# Altium project esp32p10displayProject.PrjPcb
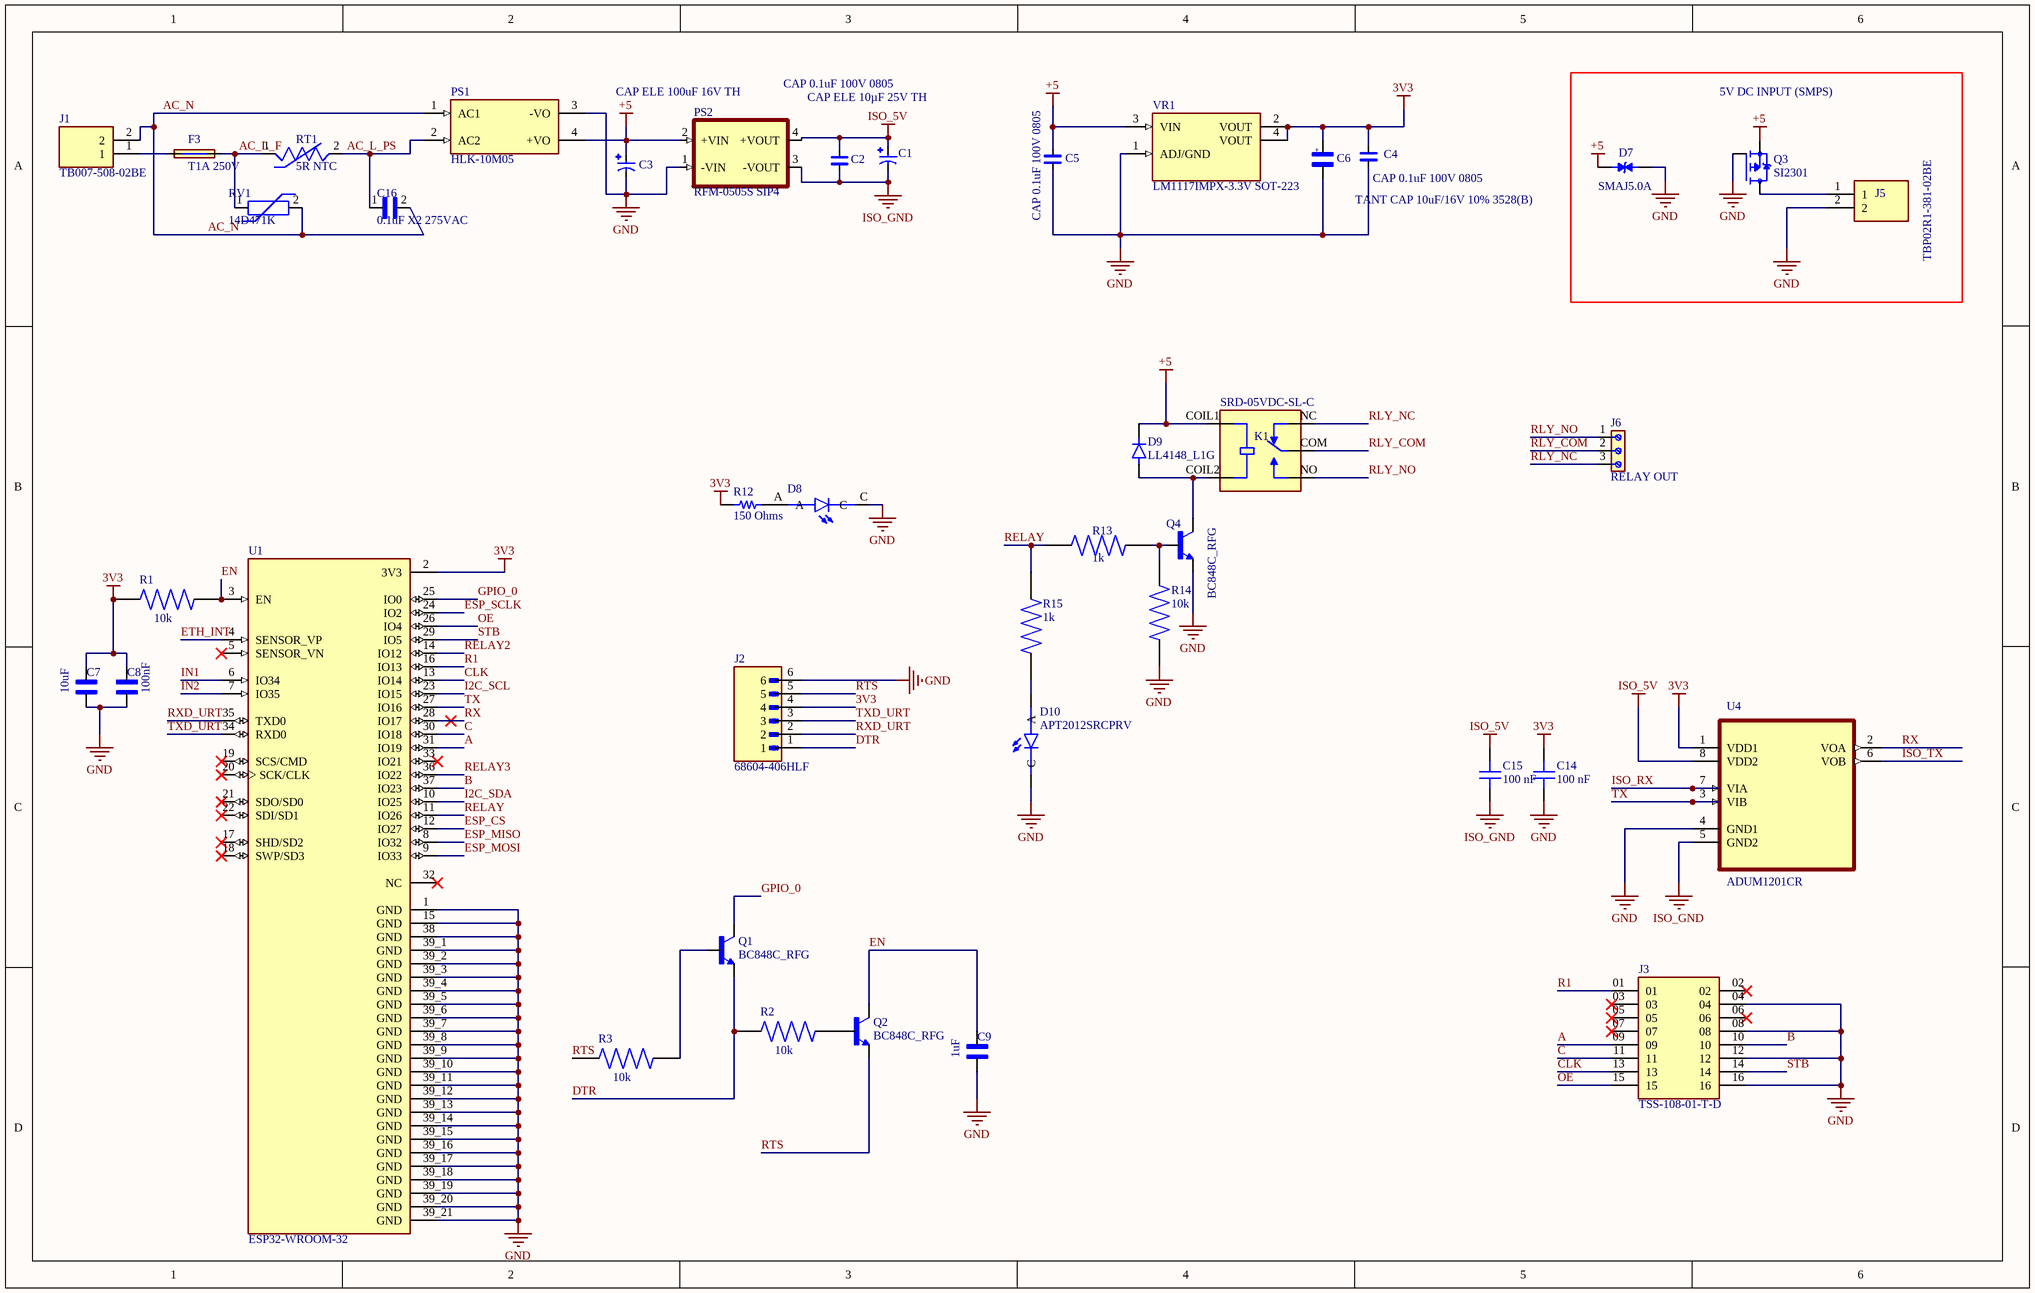
[diagram p0: esp32p10displaySheet1.SchDoc]
4 sheets, 134 parts. Net scope: global (net labels, ports and power ports of the same name join across sheets).
Board file: esp32p10displayPCB1.PcbDoc
Sheets:
  esp32p10displaySheet1.SchDoc
  esp32p10displaySheet2.SchDoc
  esp32p10displaySheet3.SchDoc
  esp32p10displaySheet4.SchDoc

## Sheet esp32p10displaySheet1.SchDoc
size 381 x 241 mm; SheetNumber: 1; SheetTotal: 4

### Parts
C1  CAP ELE 10µF 25V TH  [CAP ELE 10µF 25V TH]
C2  CAP 0.1uF 100V 0805  [CAP CER 0.1uF/50V 5%]
C3  CAP ELE 100uF 16V TH  [CAP ELE 10µF 25V TH]
C4  CAP 0.1uF 100V 0805  [CAP CER 0.1uF/50V 5%]
C5  CAP 0.1uF 100V 0805  [CAP CER 0.1uF/50V 5%]
C6  TANT CAP 10uF/16V 10% 3528(B)  [TANT CAP 3528(B)]
C7  10uF  [CAPC3216X175N]
C8  100nF  [CAPC3216X175N]
C9  1uF  [CAPC3216X175N]
C14  Capacitance: 100 nF  [CAP 0805_2012]  (hidden comment: 100nF)
C15  Capacitance: 100 nF  [CAP 0805_2012]  (hidden comment: 100nF)
C16  0.1uF X2 275VAC  [CAPRR1500W60L1750T500H1200]
D7  SMAJ5.0A  [DIOM4325X250N]
D8  597-3305-607F  [LEDC2012X70N]  (value not drawn)
D9  LL4148_L1G  [DIOMELF3515N]
D10  APT2012SRCPRV  [LEDC2012X75N]
F3  T1A 250V  [TR5]
J1  TB007-508-02BE  [CUI_TB007-508-02BE]
J2  68604-406HLF  [AMPHENOL_68604-406HLF]
J3  TSS-108-01-T-D  [SAMTEC_TSS-108-01-T-D]
J5  TBP02R1-381-02BE  [CUI_TBP02R138102BE]
J6  RELAY OUT  [691236510003]
K1  SRD-05VDC-SL-C  [RELAY_SRD-03VDC-SL-C]
PS1  HLK-10M05  [CONV_HLK-10M05]
PS2  RFM-0505S SIP4  [RFM-0505S]
Q1  BC848C_RFG  [SOT95P237X112-3N]
Q2  BC848C_RFG  [SOT95P237X112-3N]
Q3  SI2301  [DESTO_SOT23]
Q4  BC848C_RFG  [SOT95P237X112-3N]
R1  10k  [RES_ERA6VRB1002V]
R2  10k  [RES_ERA6VRB1002V]
R3  10k  [RES_ERA6VRB1002V]
R12  150 Ohms  [RES 0805_2012]
R13  1k  [RES_ERA6VRB1002V]
R14  10k  [RES_ERA6VRB1002V]
R15  1k  [RES_ERA6VRB1002V]
RT1  5R NTC  [THRMRB500W60L1150T500H1600]
RV1  14D471K  [MOV14D471K]
U1  ESP32-WROOM-32  [MODULE_ESP32-WROOM-32]
U4  ADUM1201CR  [SOIC127P600X175-8N]
VR1  LM1117IMPX-3.3V SOT-223  [LM1117IMPX-3.3V SOT-223]

### Blocks framed on the sheet
5V DC INPUT (SMPS): D7 J5 Q3

### Nets
3V3: C4.2 C6.1 C7.1 C8.1 C14.2 J2.4 R1.1 R12.1 U1.2(3V3) U4.1(VDD1) VR1.2(VOUT) VR1.4(VOUT)
+5: C3.P C5.2 D7.C D9.C(K) K1.COIL1 PS1.4(+VO) PS2.2(+VIN) Q3.2(S) VR1.3(VIN)
GND: C3.N C4.1 C5.1 C6.2 C7.2 C8.2 C9.2 C14.1 D7.A D8.C D10.C J2.6 J3.04 J3.08 J3.12 J3.16 J5.2 PS1.3(-VO) PS2.1(-VIN) Q3.1(G) Q4.2(E) R14.1 U1.1(GND) U1.15(GND) U1.38(GND) U1.39_1(GND) U1.39_2(GND) U1.39_3(GND) U1.39_4(GND) U1.39_5(GND) U1.39_6(GND) U1.39_7(GND) U1.39_8(GND) U1.39_9(GND) U1.39_10(GND) U1.39_11(GND) U1.39_12(GND) U1.39_13(GND) U1.39_14(GND) U1.39_15(GND) U1.39_16(GND) U1.39_17(GND) U1.39_18(GND) U1.39_19(GND) U1.39_20(GND) U1.39_21(GND) U4.4(GND1) VR1.1(ADJ/GND)
ISO_5V: C1.P C2.2 C15.2 PS2.4(+VOUT) U4.8(VDD2)
ISO_GND: C1.N C2.1 C15.1 PS2.3(-VOUT) U4.5(GND2)
A: J3.09 U1.31(IO19)
AC_L_F: F3.2 RT1.1 RV1.1
AC_L_PS: C16.1 PS1.2(AC2) RT1.2
AC_N: C16.2 J1.2 PS1.1(AC1) RV1.2
B: J3.10 U1.37(IO23)
C: J3.11 U1.30(IO18)
CLK: J3.13 U1.13(IO14)
DTR: J2.1 Q1.2(E) R2.1
EN: C9.1 Q2.3(C) R1.2 U1.3(EN)
ESP_CS: U1.12(IO27)
ESP_MISO: U1.8(IO32)
ESP_MOSI: U1.9(IO33)
ESP_SCLK: U1.24(IO2)
ETH_INT: U1.4(SENSOR_VP)
GPIO_0: Q1.3(C) U1.25(IO0)
I2C_SCL: U1.23(IO15)
I2C_SDA: U1.10(IO25)
IN1: U1.6(IO34)
IN2: U1.7(IO35)
ISO_RX: U4.7(VIA)
ISO_TX: U4.6(VOB)
OE: J3.15 U1.26(IO4)
R1: J3.01 U1.16(IO13)
RELAY: R13.1 R15.2 U1.11(IO26)
RELAY2: U1.14(IO12)
RELAY3: U1.36(IO22)
RLY_COM: J6.2 K1.COM
RLY_NC: J6.3 K1.NC
RLY_NO: J6.1 K1.NO
RTS: J2.5 Q2.2(E) R3.1
RX: U1.28(IO17) U4.2(VOA)
RXD_URT: J2.2 U1.35(TXD0)
STB: J3.14 U1.29(IO5)
TX: U1.27(IO16) U4.3(VIB)
TXD_URT: J2.3 U1.34(RXD0)
NetD8_A: D8.A R12.2
NetD9_A: D9.A K1.COIL2 Q4.3(C)
NetD10_A: D10.A R15.1
NetF3_1: F3.1 J1.1
NetJ5_1: J5.1 Q3.3(D)
NetQ1_1: Q1.1(B) R3.2
NetQ2_1: Q2.1(B) R2.2
NetQ4_1: Q4.1(B) R13.2 R14.2

Not connected (* = marked no-connect by the designer): J3 02* 03* 05* 06* 07*; U1 5(SENSOR_VN)* 17(SHD/SD2)* 18(SWP/SD3)* 19(SCS/CMD)* 20(SCK/CLK)* 21(SDO/SD0)* 22(SDI/SD1)* 32(NC)* 33(IO21)*

### Notes on the sheet
- (in symbol TANT CAP 10uF/16V 5% 3528(B)) +

### Library data of the parts
C1 = CAP ELE 10µF 25V TH: 10µF 25V Aluminum Electrolytic Capacitors Radial Lead Type TH, Dia-5mm, Pitch-2mm ECEA1EN100UI; MF: Panasonic; Package: RADIAL-2 Panasonic; Purchase-URL: https://pricing.snapeda.com/search/part/ECEA1EN100UI/?ref=eda; Value: *; Digi-Key_Part_Number: ECE-A1EN100UI-ND; SnapEDA_Link: https://www.snapeda.com/parts/ECEA1EN100UI/Panasonic/view-part/5788532/?ref=snap; MP: ECEA1EN100UI; Check_prices: https://www.snapeda.com/parts/ECEA1EN100UI/Panasonic/view-part/5788532/?ref=eda
C2 = CAP CER 0.1uF/50V 5%: CAP CER 0.1uF/100V  Ceramic Capacitor X7R 0805 (2012 Metric); MF: Samsung; MP: CL21B104KCFNNNE; Purchase-URL: https://pricing.snapeda.com/search?q=CL21B104KCFNNNE&ref=eda; Package: 0805 Samsung; Check_prices: https://www.snapeda.com/parts/CL21B104KCFNNNE/Samsung+Electro-Mechanics/view-part/?ref=eda; Value: *; SnapEDA_Link: https://www.snapeda.com/parts/CL21B104KCFNNNE/Samsung+Electro-Mechanics/view-part/?ref=snap; Digi-Key_Part_Number: 1276-6840-2-ND
C3 = CAP ELE 10µF 25V TH: 100uF 16V Aluminum Electrolytic Capacitor Radial TH, Dia-5mm x 11mm (Panasonic M series); MP: ECA-1CM101; Package: RADIAL-2 Panasonic; MF: Panasonic; Value: *
C4 C5 = CAP CER 0.1uF/50V 5%: CAP CER 0.1uF/100V  Ceramic Capacitor X7R 0805 (2012 Metric) SMT; MF: Samsung; MP: CL21B104KCFNNNE; Purchase-URL: https://pricing.snapeda.com/search?q=CL21B104KCFNNNE&ref=eda; Package: 0805 Samsung; Check_prices: https://www.snapeda.com/parts/CL21B104KCFNNNE/Samsung+Electro-Mechanics/view-part/?ref=eda; Value: *; SnapEDA_Link: https://www.snapeda.com/parts/CL21B104KCFNNNE/Samsung+Electro-Mechanics/view-part/?ref=snap; Digi-Key_Part_Number: 1276-6840-2-ND
C6 = TANT CAP 10uF/16V 5% 3528(B): 10 µF Molded Tantalum Capacitor 16V 10% 1411 (3528 Metric), 1210 TAJB106K016RNJ; MF: AVX; SnapEDA_Link: https://www.snapeda.com/parts/TAJB106K016RNJ/AVX/view-part/?ref=snap; Package: 1210 AVX; Value: *; MP: TAJB106K016RNJ; Check_prices: https://www.snapeda.com/parts/TAJB106K016RNJ/AVX/view-part/?ref=eda
C7 = C1206C102KGRACAUTO: 10 µF ±10% 16V Ceramic Capacitor X7R 1206 (3216 Metric); MF: Murata; MP: GRM31CR71C106KAC7L; SnapEDA_Link: https://www.snapeda.com/search?q=GRM31CR71C106KAC7L&ref=snap; Package: 3216 KEMET; Value: *; Check_prices: https://www.snapeda.com/search?q=GRM31CR71C106KAC7L&ref=eda
C8 = C1206C102KGRACAUTO: 0.1 µF ±10% 50V Ceramic Capacitor X7R 1206 (3216 Metric); MF: KEMET; MP: C1206C104K5RACTU; SnapEDA_Link: https://www.snapeda.com/search?q=C1206C104K5RACTU&ref=snap; Package: 3216 KEMET; Value: *; Check_prices: https://www.snapeda.com/search?q=C1206C104K5RACTU&ref=eda
C9 = C1206C102KGRACAUTO: 1 µF ±10% 50V Ceramic Capacitor X7R 1206 (3216 Metric); MF: KEMET; MP: C1206C105K5RACTU; SnapEDA_Link: https://www.snapeda.com/search?q=C1206C105K5RACTU&ref=snap; Package: 3216 KEMET; Value: *; Check_prices: https://www.snapeda.com/search?q=C1206C105K5RACTU&ref=eda
C14 C15 = C0805C102F3HACAUTO: CAP CER 0805 0.1UF 100V X7R; Part Number: CL21B104KCFNNNE; manufacturer: Samsung Electro-Mechanics; Tolerance: ±10%; Applications: General Purpose; componentlink1description: Datasheet; componentlink1url: https://pricing.snapeda.com/search?q=CL21B104KCFNNNE&ref=eda; componentlink2description: DigiKey Link; componentlink2url: https://www.digikey.com/en/products/result?keywords=CL21B104KCFNNNE; Device Package: 0805 (2012 Metric); lastupdated: 09-02-2024 8.15.10 PM; Lifecycle Status: Active; Minimum Order: 1; Mounting Type: Surface Mount, MLCC; Operating Temperature: -55°C ~ 125°C; Package / Case: 0805 (2012 Metric); packaging: TapeAndReel; Part Status: Active; series: CL; Size / Dimension: 0.079" L x 0.049" W (2.00mm x 1.25mm); Supplier 1: DigiKey; Temperature Coefficient: X7R; Thickness (Max): 0.85mm; value: 100 nF; Voltage - Rated: 100V
C16 = ECQUAAF104M: Film Capacitor X2 0.1uF 275VAC 15mm pitch; Availability: Unavailable; Price: None; MP: ECQUAAF104M; Package: None; Value: *
D7 = SMAJ7.5CA: TVS diode unidirectional 5V standoff 400W SMA (DO-214AC); pin 1 = cathode; Availability: Unavailable; Package: None; MP: SMAJ5.0A; Value: *; Price: None
D8 = 597-3305-607F: LED Uni-Color Green 4-Pin Chip 0805 T/R; Availability: Unavailable; Value: *; Price: None; MP: 597-3305-607F; Package: None
D10 = APT2012SRCPRV: Red 640nm LED Indication - Discrete 1.85V 0805 (2012 Metric); MF: Kingbright; SnapEDA_Link: https://www.snapeda.com/parts/APT2012SRCPRV/Kingbright/view-part/?ref=snap; Package: 0805 Kingbright; Value: *; MP: APT2012SRCPRV; Check_prices: https://www.snapeda.com/parts/APT2012SRCPRV/Kingbright/view-part/?ref=eda
F3 = TR5: Fuse TR5 1A Time-Lag 250VAC (Littelfuse 372 series); MF: Taiyo Yuden; SnapEDA_Link: https://www.snapeda.com/parts/TR5/Taiyo+Yuden/view-part/?ref=snap; Package: None; Value: *; MP: TR5; Check_prices: https://www.snapeda.com/parts/TR5/Taiyo+Yuden/view-part/?ref=eda
J1 = TB007-508-02BE: 2~24 Poles, Screw Type, Horizontal, 5.08 Pitch, 24~12 (AWG), Terminal Block Connector; MF: Same Sky; SnapEDA_Link: https://www.snapeda.com/parts/TB007-508-02BE/Same+Sky/view-part/?ref=snap; Package: None; Value: *; MP: TB007-508-02BE; Check_prices: https://www.snapeda.com/parts/TB007-508-02BE/Same+Sky/view-part/?ref=eda
J2 = 68604-406HLF: BergStik, Board to Board connector, Unshrouded Vertical Header, Through Hole, Single Row, 6 Positions, 2.54 mm (0.100in) Pitch.; MF: AMPHENOL ICC / FCI; SnapEDA_Link: https://www.snapeda.com/parts/68604-406HLF/Amphenol/view-part/?ref=snap; Package: None; Value: *; MP: 68604-406HLF; Check_prices: https://www.snapeda.com/parts/68604-406HLF/Amphenol/view-part/?ref=eda
J5 = TBP02R138102BE: Terminal block header 2-pos 3.81 mm, right angle (mating plug TBP01P1-381-02BE); MF: Same Sky (CUI); SnapEDA_Link: https://www.snapeda.com/parts/TBP02R1-381-02BE/Same+Sky/view-part/?ref=snap; Package: None; Value: *; MP: TBP02R1-381-02BE; Check_prices: https://www.snapeda.com/parts/TBP02R1-381-02BE/Same+Sky/view-part/?ref=eda
J6 = 691236510003: 3 Position Wire to Board Terminal Block Horizontal with Board 0.200 (5.08mm) Through Hole; MF: WÃ¼rth Elektronik; SnapEDA_Link: https://www.snapeda.com/parts/691236510003/W%25C3%25BCrth+Elektronik+Midcom/view-part/?ref=snap; Package: None; Value: *; MP: 691236510003; Check_prices: https://www.snapeda.com/parts/691236510003/W%25C3%25BCrth+Elektronik+Midcom/view-part/?ref=eda
K1 = SRD-03VDC-SL-C: Relays General Purpose Non Latching 3VDC SPDT 10A (250VAC) Max 5PIN; Manufacturer: Songle; MF: Songle Relay; SnapEDA_Link: https://www.snapeda.com/parts/SRD-03VDC-SL-C/Songle+Relay/view-part/?ref=snap; Package: NON STANDARD-5 Songle Relay; Value: *; MP: SRD-05VDC-SL-C; Check_prices: https://www.snapeda.com/parts/SRD-03VDC-SL-C/Songle+Relay/view-part/?ref=eda
PS1 = HLK-10M05: 10W Ultra-Compact Power Module; MF: Hi-link; SnapEDA_Link: https://www.snapeda.com/parts/HLK-10M05/Hi-link/view-part/?ref=snap; Package: Package; Value: *; MP: HLK-10M05; Check_prices: https://www.snapeda.com/parts/HLK-10M05/Hi-link/view-part/?ref=eda
PS2 = RFM-0505S: DC-DC Converter/Isolator, SIP4, 1kV unreg, Single Output, 1W, 5V Out, RFM Series | RECOM Power Inc. RFM-0505S; SnapEDA_Link: https://www.snapeda.com/parts/RFM-0505S/Recom+Power/view-part/?ref=snap; Package: SIP-4 Recom Power; Value: *; MF: Recom Power; MP: RFM-0505S; Check_prices: https://www.snapeda.com/parts/RFM-0505S/Recom+Power/view-part/?ref=eda
Q1 Q2 Q4 = BC848C_RFG: SOT-23, 30V, 0.1A, NPN Transistor; MF: Taiwan Semiconductor; MP: BC848C RFG; SnapEDA_Link: https://www.snapeda.com/parts/BC848C%20RFG/Taiwan+Semiconductor/view-part/?ref=snap; Package: SOT-23 Taiwan Semiconductor; Value: *; Check_prices: https://www.snapeda.com/parts/BC848C%20RFG/Taiwan+Semiconductor/view-part/?ref=eda
Q3 = SI2301: P-MOSFET 20V 2.3A SOT-23, reverse-polarity protection for 5V DC input; MF: Vishay; MP: SI2301CDS-T1-GE3; SnapEDA_Link: https://www.snapeda.com/parts/SI2301/Micro+Commercial+Components/view-part/?ref=snap; Package: SOT-23 MCC; Value: *; Check_prices: https://www.snapeda.com/parts/SI2301/Micro+Commercial+Components/view-part/?ref=eda
R1-R3 R14 = ERA6VRB1002V: Availability: Unavailable; Package: None; MP: ERA6VRB1002V; Value: *; Price: None
R12 = CRCW0805330RFKEAHP: RES SMD 150 OHM 1% 1/2W 0805; Part Number: CRCW0805150RFKEAHP; Manufacturer: Vishay Dale; Power (Watts): 0.5W, 1/2W; Temperature Coefficient: ±100ppm/°C; Value: 150 Ohms; ComponentLink1Description: Datasheet; ComponentLink1URL: http://www.vishay.com/docs/20043/crcwhpe3.pdf; ComponentLink2Description: DigiKey Link; ComponentLink2URL: https://www.digikey.com/en/products/detail/vishay-dale/CRCW0805150RFKEAHP/2222332; Composition: Thick Film; Device Package: 0805 (2012 Metric); Features: Automotive AEC-Q200, Pulse Withstanding; Height - Seated (Max): 0.020" (0.50mm); LastUpdated: 08-02-2024 9.02.28 PM; Lifecycle Status: Active; Minimum Order: 1; Number of Terminations: 2; Operating Temperature: -55°C ~ 155°C; Package / Case: 0805 (2012 Metric); Packaging: TapeAndReel; PartId: 30364; Part Status: Active; Price: 0.02; Ratings: AEC-Q200; Resistance: 150 Ohms; Series: CRCW-HP; Size / Dimension: 0.079" L x 0.049" W (2.00mm x 1.25mm); Supplier 1: DigiKey; Supplier Part Number 1: 541-150TCT-ND; Supplier Device Package: 0805; Tolerance: ±1%
R13 R15 = ERA6VRB1002V: MP: ERA6VRB1001V; Availability: Unavailable; Package: None; Value: *; Price: None
RT1 = B57236S0509M000: NTC Inrush Current Limiter 5 Ohm 20% 4.5A 11.5mm; MF: EPCOS - TDK Electronics; SnapEDA_Link: https://www.snapeda.com/parts/B57236S0509M000/TDK/view-part/?ref=snap; Package: None; Value: *; MP: B57236S0509M000; Check_prices: https://www.snapeda.com/parts/B57236S0509M000/TDK/view-part/?ref=eda
RV1 = MOV-14D471K: Varistor 14mm 470V (300VAC); MF: HuaXingAn Electronics; SnapEDA_Link: https://www.snapeda.com/parts/MOV-14D471K/HuaXingAn+Electronics/view-part/?ref=snap; Package: None; Value: *; MP: MOV-14D471K; Check_prices: https://www.snapeda.com/parts/MOV-14D471K/HuaXingAn+Electronics/view-part/?ref=eda
U1 = ESP32-WROOM-32: Bluetooth, WiFi 802.11b/g/n, Bluetooth v4.2 +EDR, Class 1, 2 and 3 Transceiver Module 2.4GHz ~ 2.5GHz Antenna Not Included, U.FL Surface Mount; MF: Espressif Systems; Price: None; Availability: In Stock; MP: ESP32-WROOM-32; Package: Module Espressif Systems; SnapEDA_Link: https://www.snapeda.com/parts/ESP32-WROOM-32/Espressif+Systems/view-part/?ref=snap; Check_prices: https://www.snapeda.com/parts/ESP32-WROOM-32/Espressif+Systems/view-part/?ref=eda; Value: *; Purchase-URL: https://pricing.snapeda.com/search/part/ESP32-WROOM-32/?ref=eda
U4 = ADUM1201CR: General Purpose Digital Isolator 2500Vrms 2 Channel 25Mbps 8-SOIC; MF: Analog Devices; SnapEDA_Link: https://www.snapeda.com/parts/ADUM1201CR/Analog+Devices/view-part/?ref=snap; Package: SOIC-8 Analog Devices; Value: *; MP: ADUM1201CR; Check_prices: https://www.snapeda.com/parts/ADUM1201CR/Analog+Devices/view-part/?ref=eda
VR1 = LM1117IMPX-3.3V SOT-223: LM1117IMPX-3.3V 800-mA 15-V linear voltage regulator SOT-223; MF: Texas Instruments; MP: LM1117IMPX-3.3/NOPB; SnapEDA_Link: https://www.snapeda.com/parts/LM1117IMPX-3.3/NOPB/Texas+Instruments/view-part/?ref=snap; Package: SOT-223-4 Texas Instruments; Value: *; Check_prices: https://www.snapeda.com/parts/LM1117IMPX-3.3/NOPB/Texas+Instruments/view-part/?ref=eda
D9 = LL4148_L1G: MP: LL4148_L1G; Price: None; Package: None; Availability: Unavailable; Value: *
J3 = TSS-108-01-T-D: Availability: Unavailable; MP: TSS-108-01-T-D; Value: *; Price: None; Package: None

## Sheet esp32p10displaySheet2.SchDoc
size A4; SheetNumber: 2; SheetTotal: 4
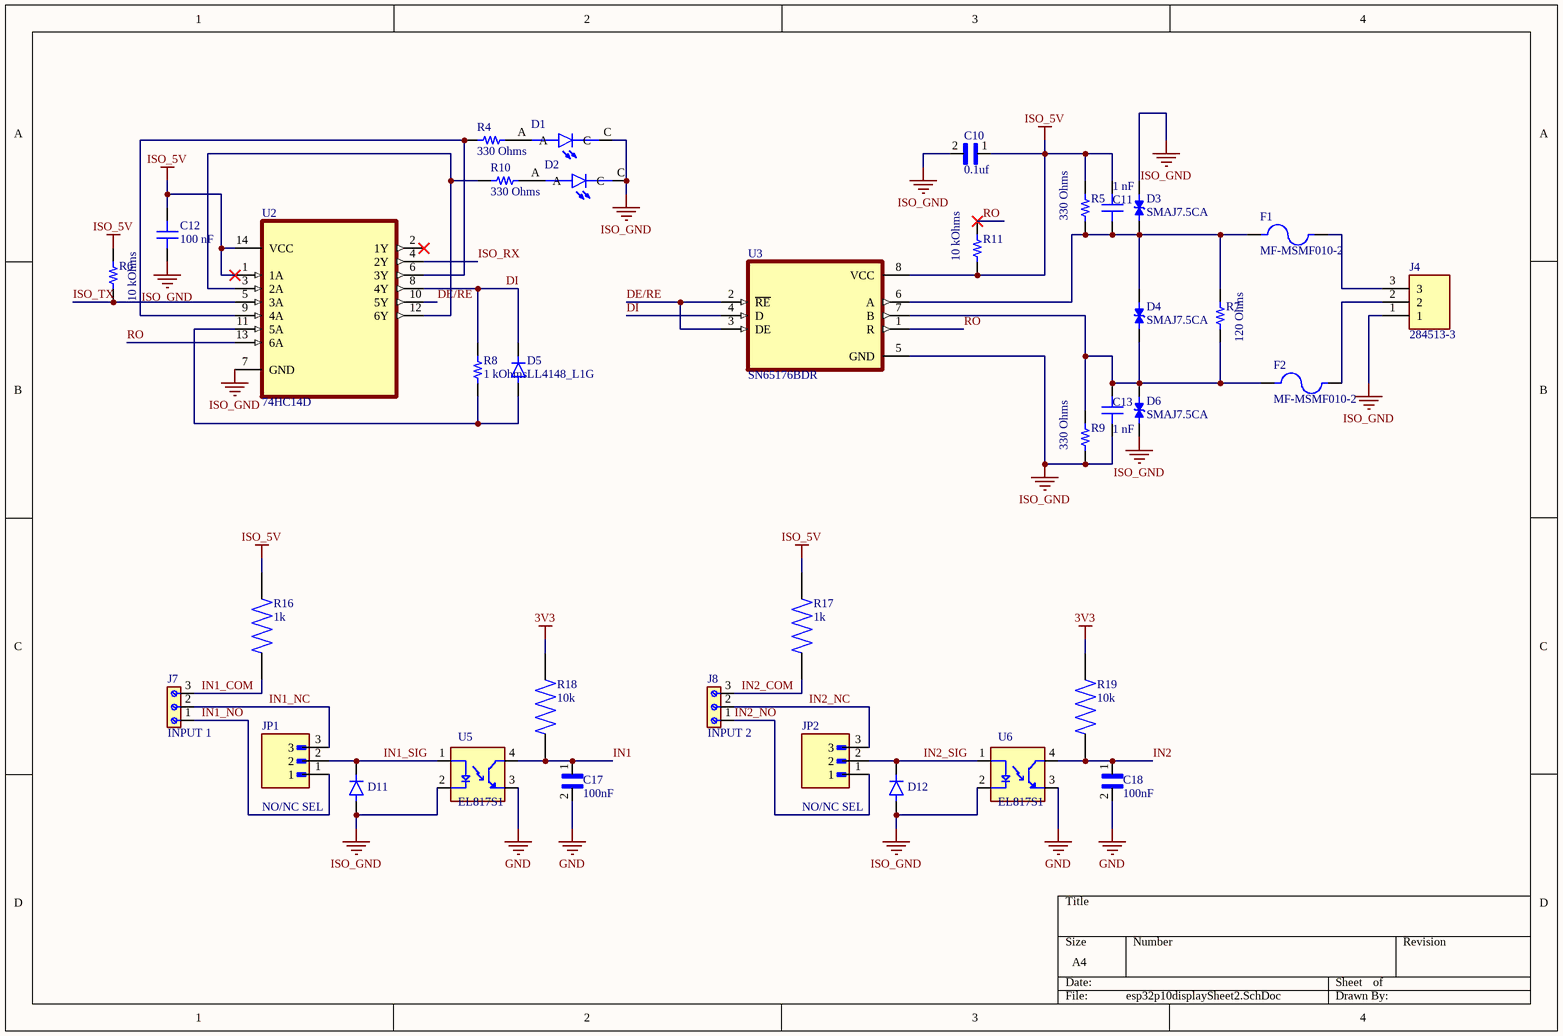
[diagram p1: esp32p10displaySheet2.SchDoc]

### Parts
C10  0.1uf  [CAPC2012X140N]
C11  Capacitance: 1 nF  [CAP 0805_2012]  (hidden comment: 1nF)
C12  Capacitance: 100 nF  [CAP 0805_2012]  (hidden comment: 100nF)
C13  Capacitance: 1 nF  [CAP 0805_2012]  (hidden comment: 1nF)
C17  100nF  [CAPC2012X140N]
C18  100nF  [CAPC2012X140N]
D1  597-3305-607F  [LEDC2012X70N]  (value not drawn)
D2  597-3305-607F  [LEDC2012X70N]  (value not drawn)
D3  SMAJ7.5CA  [DIOM4325X250N]
D4  SMAJ7.5CA  [DIOM4325X250N]
D5  LL4148_L1G  [DIOMELF3515N]
D6  SMAJ7.5CA  [DIOM4325X250N]
D11  LL4148_L1G  [DIOMELF3515N]  (value not drawn)
D12  LL4148_L1G  [DIOMELF3515N]  (value not drawn)
F1  MF-MSMF010-2  [FUSER_MF-MSMF010-2]
F2  MF-MSMF010-2  [FUSER_MF-MSMF010-2]
J4  284513-3  [TE_284513-3]
J7  INPUT 1  [691236510003]
J8  INPUT 2  [691236510003]
JP1  NO/NC SEL  [AMPHENOL_68001-403HLF]
JP2  NO/NC SEL  [AMPHENOL_68001-403HLF]
R4  330 Ohms  [RES 0805_2012]
R5  330 Ohms  [RES 0805_2012]
R6  10 kOhms  [RES 0805_2012]
R7  120 Ohms  [RES 0805_2012]
R8  1 kOhms  [RES 0805_2012]
R9  330 Ohms  [RES 0805_2012]
R10  330 Ohms  [RES 0805_2012]
R11  10 kOhms  [RES 0805_2012]
R16  1k  [RES_ERA6VRB1002V]
R17  1k  [RES_ERA6VRB1002V]
R18  10k  [RES_ERA6VRB1002V]
R19  10k  [RES_ERA6VRB1002V]
U2  74HC14D  [SOIC127P600X175-14N]
U3  SN65176BDR  [SOIC127P599X175-8N]
U5  EL817S1  [SOIC254P1030X390-4N_EL817S1(A)(TU)-V]
U6  EL817S1  [SOIC254P1030X390-4N_EL817S1(A)(TU)-V]

### Nets
3V3: R18.2 R19.2
GND: C17.2 C18.2 U5.3(ET) U6.3(ET)
ISO_5V: C10.1 C11.2 C12.2 R5.2 R6.2 R11.1 R16.2 R17.2 U2.1(1A) U2.14(VCC) U3.8(VCC)
ISO_GND: C10.2 C12.1 C13.1 D1.C D2.C D3.2 D6.1 D11.A D12.A J4.1 R9.1 U2.7(GND) U3.5(GND) U5.2(C) U6.2(C)
DE/RE: U2.10(5Y) U3.2(~{RE}) U3.3(DE)
DI: D5.C(K) R8.2 U2.8(4Y) U3.4(D)
IN1: C17.1 R18.1 U5.4(CT)
IN1_COM: J7.3 R16.1
IN1_NC: J7.2 JP1.3
IN1_NO: J7.1 JP1.1
IN1_SIG: D11.C(K) JP1.2 U5.1(A)
IN2: C18.1 R19.1 U6.4(CT)
IN2_COM: J8.3 R17.1
IN2_NC: J8.2 JP2.3
IN2_NO: J8.1 JP2.1
IN2_SIG: D12.C(K) JP2.2 U6.1(A)
ISO_RX: U2.4(2Y)
ISO_TX: R6.1 U2.5(3A)
RO: R11.2 U2.13(6A) U3.1(R)
NetC11_1: C11.1 D3.1 D4.2 F1.1 R5.1 R7.2 U3.6(A)
NetC13_2: C13.2 D4.1 D6.2 F2.1 R7.1 R9.2 U3.7(B)
NetD1_A: D1.A R4.2
NetD2_A: D2.A R10.2
NetD5_A: D5.A R8.1 U2.11(5A)
NetF1_2: F1.2 J4.3
NetF2_2: F2.2 J4.2
NetR4_1: R4.1 U2.6(3Y) U2.9(4A)
NetR10_1: R10.1 U2.3(2A) U2.12(6Y)

Not connected (* = marked no-connect by the designer): U2 2(1Y)*

### Library data of the parts
C10 C17 C18 = CL21B104KCFNNNE: 0.1 ÂµF Â±10% 100V Ceramic Capacitor X7R 0805 (2012 Metric); MF: Samsung; Purchase-URL: https://pricing.snapeda.com/search?q=CL21B104KCFNNNE&ref=eda; Package: 0805 Samsung; Check_prices: https://www.snapeda.com/parts/CL21B104KCFNNNE/Samsung+Electro-Mechanics/view-part/?ref=eda; Value: *; SnapEDA_Link: https://www.snapeda.com/parts/CL21B104KCFNNNE/Samsung+Electro-Mechanics/view-part/?ref=snap; MP: CL21B104KCFNNNE; Digi-Key_Part_Number: 1276-6840-2-ND
C11 C13 = C0805C102F3HACAUTO: CAP CER 0805 1NF 25V ULTRA STABL; manufacturer: KEMET; Temperature Coefficient: X8R; Tolerance: ±1%; value: 1000 pF; Part Number: C0805C102F3HACAUTO; Applications: Automotive; componentlink1description: Datasheet; componentlink1url: https://api.kemet.com/component-edge/download/datasheet/C0805C102F3HACAUTO.pdf; componentlink2description: DigiKey Link; componentlink2url: https://www.digikey.com/en/products/detail/kemet/C0805C102F3HACAUTO/7958218; Device Package: 0805 (2012 Metric); Features: Low ESL, High Temperature; lastupdated: 09-02-2024 8.15.10 PM; Lifecycle Status: Active; Minimum Order: 1; Mounting Type: Surface Mount, MLCC; Operating Temperature: -55°C ~ 150°C; Package / Case: 0805 (2012 Metric); packaging: TapeAndReel; partid: 32894; Part Status: Active; price: 0.04; Ratings: AEC-Q200; series: SMD Auto X8R HT150C; Size / Dimension: 0.079" L x 0.049" W (2.00mm x 1.25mm); Supplier 1: DigiKey; Supplier Part Number 1: 399-C0805C102F3HACAUTOCT-ND; Thickness (Max): 0.035" (0.88mm); Voltage - Rated: 25V
C12 = C0805C102F3HACAUTO: as C14 on sheet esp32p10displaySheet1; Applications: General Purpose; componentlink1description: Datasheet; componentlink1url: https://pricing.snapeda.com/search?q=CL21B104KCFNNNE&ref=eda; componentlink2description: DigiKey Link; componentlink2url: https://www.digikey.com/en/products/result?keywords=CL21B104KCFNNNE; Device Package: 0805 (2012 Metric); lastupdated: 09-02-2024 8.15.10 PM; Lifecycle Status: Active; Minimum Order: 1; Mounting Type: Surface Mount, MLCC; Operating Temperature: -55°C ~ 125°C; Package / Case: 0805 (2012 Metric); packaging: TapeAndReel; Part Status: Active; series: CL; Size / Dimension: 0.079" L x 0.049" W (2.00mm x 1.25mm); Supplier 1: DigiKey; Temperature Coefficient: X7R; Thickness (Max): 0.85mm; value: 100 nF; Voltage - Rated: 100V
D1 D2 = 597-3305-607F: LED Uni-Color Green 4-Pin Chip 0805 T/R; Availability: Unavailable; Value: *; Price: None; MP: 597-3305-607F; Package: None
F1 F2 = MF-MSMF010-2: Polymeric PTC Resettable Fuse 60V 100 mA Ih Surface Mount 1812 (4532 Metric), Concave; MF: Bourns; Price: None; Availability: In Stock; MP: MF-MSMF010-2; Package: 1812 Bourns; SnapEDA_Link: https://www.snapeda.com/parts/MF-MSMF010-2/Bourns/view-part/?ref=snap; Check_prices: https://www.snapeda.com/parts/MF-MSMF010-2/Bourns/view-part/?ref=eda; Value: *; Purchase-URL: https://pricing.snapeda.com/search/part/MF-MSMF010-2/?ref=eda
J4 = 284513-3: 3 Position 3.81 mm Pitch Green Right Angle Through Hole Terminal Block Header; MF: TE Connectivity; Purchase-URL: https://pricing.snapeda.com/search/part/284513-3/?ref=eda; Package: None; MP: 284513-3; EU_RoHS_Compliance: Compliant; Price: None; Availability: In Stock; Value: *; Check_prices: https://www.snapeda.com/parts/284513-3/TE+Connectivity+AMP+Connectors/view-part/?ref=eda; SnapEDA_Link: https://www.snapeda.com/parts/284513-3/TE+Connectivity+AMP+Connectors/view-part/?ref=snap
J7 J8 = 691236510003: as J6 on sheet esp32p10displaySheet1; SnapEDA_Link: https://www.snapeda.com/parts/691236510003/W%25C3%25BCrth+Elektronik+Midcom/view-part/?ref=snap; Package: None; Value: *; MP: 691236510003; Check_prices: https://www.snapeda.com/parts/691236510003/W%25C3%25BCrth+Elektronik+Midcom/view-part/?ref=eda
JP1 JP2 = 68001-403HLF: Package: None; Price: None; Value: *; MP: 68001-403HLF; Availability: Unavailable
R4 R10 = CRCW0805330RFKEAHP: RES SMD 330 OHM 1% 1/2W 0805; Manufacturer: Vishay Dale; Power (Watts): 0.5W, 1/2W; Temperature Coefficient: ±100ppm/°C; Part Number: CRCW0805330RFKEAHP; Value: 330 Ohms; ComponentLink1Description: Datasheet; ComponentLink1URL: http://www.vishay.com/docs/20043/crcwhpe3.pdf; ComponentLink2Description: DigiKey Link; ComponentLink2URL: https://www.digikey.com/en/products/detail/vishay-dale/CRCW0805330RFKEAHP/2226912; Composition: Thick Film; Device Package: 0805 (2012 Metric); Features: Automotive AEC-Q200, Pulse Withstanding; Height - Seated (Max): 0.020" (0.50mm); LastUpdated: 08-02-2024 9.02.28 PM; Lifecycle Status: Active; Minimum Order: 1; Number of Terminations: 2; Operating Temperature: -55°C ~ 155°C; Package / Case: 0805 (2012 Metric); Packaging: TapeAndReel; PartId: 30364; Part Status: Active; Price: 0.02; Ratings: AEC-Q200; Resistance: 330 Ohms; Series: CRCW-HP; Size / Dimension: 0.079" L x 0.049" W (2.00mm x 1.25mm); Supplier 1: DigiKey; Supplier Part Number 1: 541-330TCT-ND; Supplier Device Package: 0805; Tolerance: ±1%
R5 R9 = CPF0805B1K0E: RES SMD 330 OHM 1% 1/8W 0805; Part Number: RC0805FR-07330RL; Manufacturer: YAGEO; Power (Watts): 0.1W, 1/10W; Temperature Coefficient: ±25ppm/°C; Tolerance: ±0.1%; Value: 330 Ohms; ComponentLink1Description: Datasheet; ComponentLink1URL: https://www.te.com/commerce/DocumentDelivery/DDEController?Action=srchrtrv&DocNm=1773200&DocType=DS&DocLang=English; ComponentLink2Description: DigiKey Link; Composition: Thin Film; Device Package: 0805 (2012 Metric); Height - Seated (Max): 0.026" (0.65mm); LastUpdated: 08-02-2024 9.02.39 PM; Lifecycle Status: Active; Minimum Order: 1; Number of Terminations: 2; Operating Temperature: -55°C ~ 155°C; Package / Case: 0805 (2012 Metric); Packaging: TapeAndReel; PartId: 27725; Part Status: Active; Price: 0.09; Resistance: 330 Ohms; Series: CPF, Neohm; Size / Dimension: 0.079" L x 0.049" W (2.00mm x 1.25mm); Supplier 1: DigiKey; Supplier Device Package: 0805
R6 R11 = CPF0805B10KE: RES SMD 10K OHM 0.1% 1/10W 0805; Manufacturer: TE Connectivity Passive Product; Power (Watts): 0.1W, 1/10W; Temperature Coefficient: ±25ppm/°C; Part Number: CPF0805B10KE; Value: 10 kOhms; ComponentLink1Description: Datasheet; ComponentLink1URL: https://www.te.com/commerce/DocumentDelivery/DDEController?Action=srchrtrv&DocNm=1773200&DocType=DS&DocLang=English; ComponentLink2Description: DigiKey Link; ComponentLink2URL: https://www.digikey.com/en/products/detail/te-connectivity-passive-product/CPF0805B10KE/2389790; Composition: Thin Film; Device Package: 0805 (2012 Metric); Height - Seated (Max): 0.026" (0.65mm); LastUpdated: 08-02-2024 9.02.39 PM; Lifecycle Status: Active; Minimum Order: 1; Number of Terminations: 2; Operating Temperature: -55°C ~ 155°C; Package / Case: 0805 (2012 Metric); Packaging: TapeAndReel; PartId: 27724; Part Status: Active; Price: 0.09; Resistance: 10 kOhms; Series: CPF, Neohm; Size / Dimension: 0.079" L x 0.049" W (2.00mm x 1.25mm); Supplier 1: DigiKey; Supplier Part Number 1: A106043CT-ND; Supplier Device Package: 0805; Tolerance: ±0.1%
R7 = CPF0805B10KE: RES SMD 120 OHM 1% 1/8W 0805; Part Number: RC0805FR-07120RL; Manufacturer: YAGEO; Power (Watts): 0.1W, 1/10W; Temperature Coefficient: ±25ppm/°C; Tolerance: ±0.1%; Value: 120 Ohms; ComponentLink1Description: Datasheet; ComponentLink1URL: https://www.te.com/commerce/DocumentDelivery/DDEController?Action=srchrtrv&DocNm=1773200&DocType=DS&DocLang=English; ComponentLink2Description: DigiKey Link; Composition: Thin Film; Device Package: 0805 (2012 Metric); Height - Seated (Max): 0.026" (0.65mm); LastUpdated: 08-02-2024 9.02.39 PM; Lifecycle Status: Active; Minimum Order: 1; Number of Terminations: 2; Operating Temperature: -55°C ~ 155°C; Package / Case: 0805 (2012 Metric); Packaging: TapeAndReel; PartId: 27724; Part Status: Active; Price: 0.09; Resistance: 120 Ohms; Series: CPF, Neohm; Size / Dimension: 0.079" L x 0.049" W (2.00mm x 1.25mm); Supplier 1: DigiKey; Supplier Device Package: 0805
R8 = CPF0805B1K0E: RES SMD 1K OHM 0.1% 1/10W 0805; Manufacturer: TE Connectivity Passive Product; Power (Watts): 0.1W, 1/10W; Temperature Coefficient: ±25ppm/°C; Part Number: CPF0805B1K0E; Value: 1 kOhms; ComponentLink1Description: Datasheet; ComponentLink1URL: https://www.te.com/commerce/DocumentDelivery/DDEController?Action=srchrtrv&DocNm=1773200&DocType=DS&DocLang=English; ComponentLink2Description: DigiKey Link; ComponentLink2URL: https://www.digikey.com/en/products/detail/te-connectivity-passive-product/CPF0805B1K0E/2390399; Composition: Thin Film; Device Package: 0805 (2012 Metric); Height - Seated (Max): 0.026" (0.65mm); LastUpdated: 08-02-2024 9.02.39 PM; Lifecycle Status: Active; Minimum Order: 1; Number of Terminations: 2; Operating Temperature: -55°C ~ 155°C; Package / Case: 0805 (2012 Metric); Packaging: TapeAndReel; PartId: 27725; Part Status: Active; Price: 0.09; Resistance: 1 kOhms; Series: CPF, Neohm; Size / Dimension: 0.079" L x 0.049" W (2.00mm x 1.25mm); Supplier 1: DigiKey; Supplier Part Number 1: A106044CT-ND; Supplier Device Package: 0805; Tolerance: ±0.1%
R16 R17 = ERA6VRB1002V: MP: ERA6VRB1001V; Availability: Unavailable; Package: None; Value: *; Price: None
R18 R19 = ERA6VRB1002V: Availability: Unavailable; Package: None; MP: ERA6VRB1002V; Value: *; Price: None
U2 = 74HC14D: Inverter IC 6 Channel Schmitt Trigger 14-SOIC; MF: Toshiba; SnapEDA_Link: https://www.snapeda.com/parts/74HC14D/Toshiba/view-part/?ref=snap; Package: SO14-14 Nexperia USA Inc.; Value: *; MP: 74HC14D; Check_prices: https://www.snapeda.com/parts/74HC14D/Toshiba/view-part/?ref=eda
U3 = SN65176BDR: Differential Bus Transceiver; MF: Texas Instruments; SnapEDA_Link: https://www.snapeda.com/parts/SN65176BDR/Texas+Instruments/view-part/?ref=snap; Package: SOIC-8 Texas Instruments; Value: *; MP: SN65176BDR; Check_prices: https://www.snapeda.com/parts/SN65176BDR/Texas+Instruments/view-part/?ref=eda
U5 U6 = EL817S1(A)(TU)-V: Optoisoltr 5kv Transistor 4-Smd; MF: {'manufacturer': u'Everlight Electronics Co Ltd'}; Package: None; Price: None; Value: *; MP: EL817S1(A)(TU)-V; Availability: Unavailable
D3 D4 D6 = SMAJ7.5CA: Availability: Unavailable; Package: None; MP: SMAJ7.5CA; Value: *; Price: None
D5 D11 D12 = LL4148_L1G: MP: LL4148_L1G; Price: None; Package: None; Availability: Unavailable; Value: *

## Sheet esp32p10displaySheet3.SchDoc
size A4; SheetNumber: 3; SheetTotal: 4
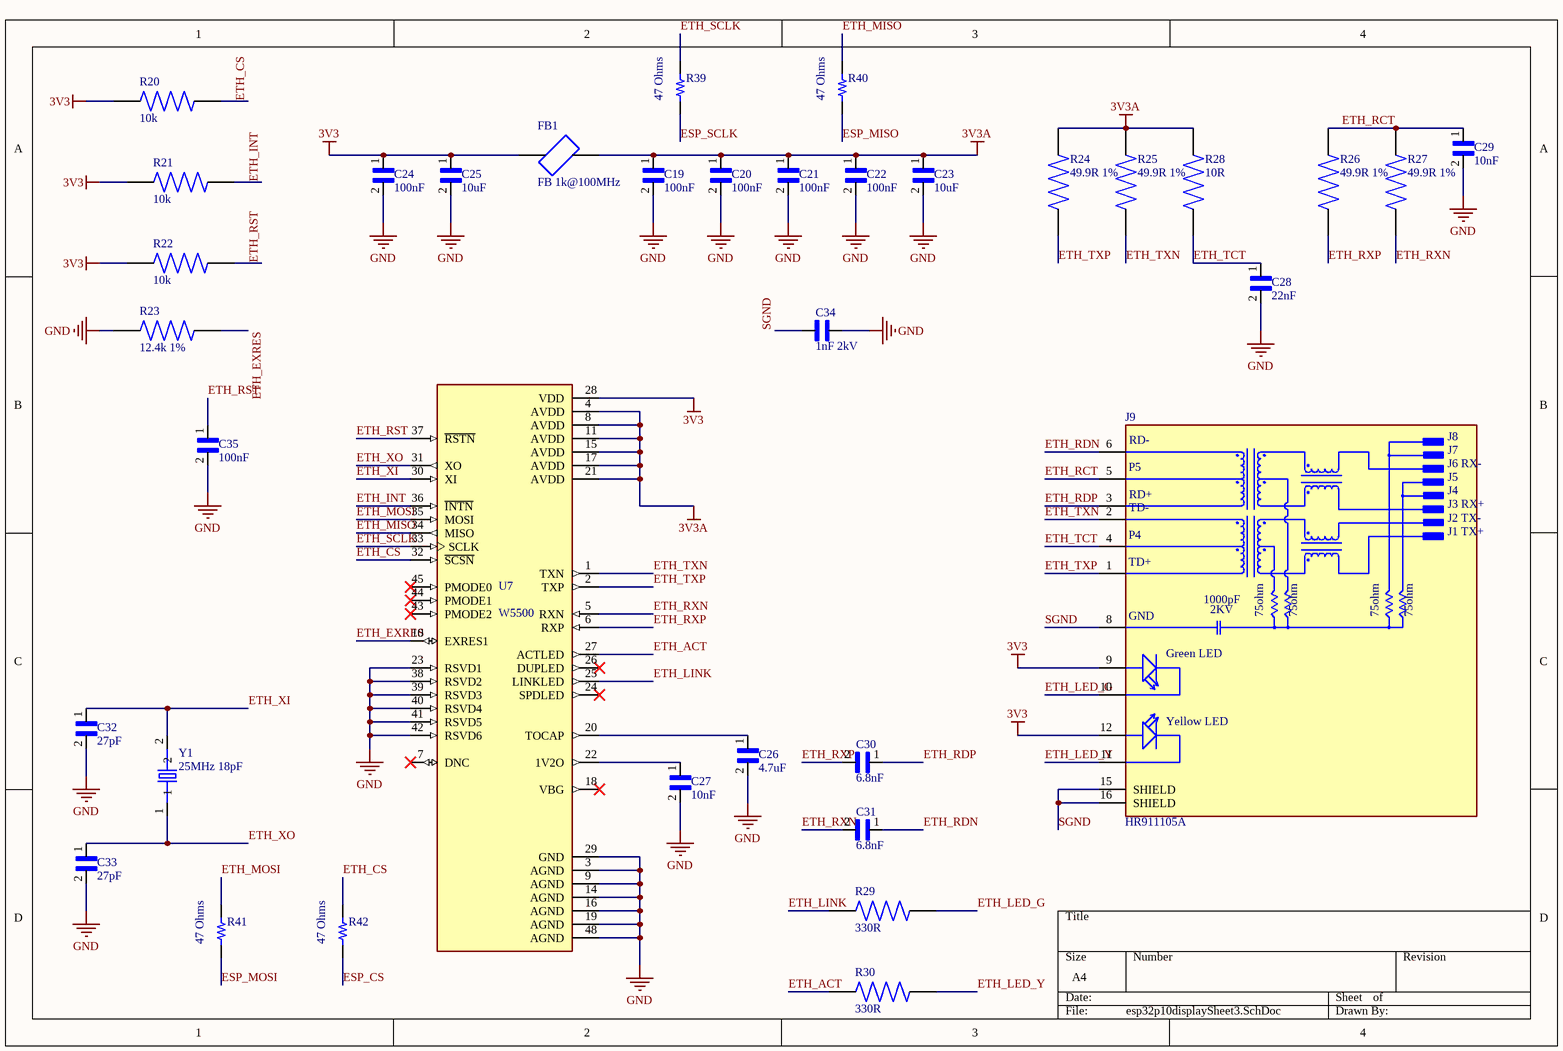
[diagram p2: esp32p10displaySheet3.SchDoc]

### Parts
C19  100nF  [CAPC2012X140N]
C20  100nF  [CAPC2012X140N]
C21  100nF  [CAPC2012X140N]
C22  100nF  [CAPC2012X140N]
C23  10uF  [CAPC2012X140N]
C24  100nF  [CAPC2012X140N]
C25  10uF  [CAPC2012X140N]
C26  4.7uF  [CAPC2012X140N]
C27  10nF  [CAPC2012X140N]
C28  22nF  [CAPC2012X140N]
C29  10nF  [CAPC2012X140N]
C30  6.8nF  [CAPC2012X140N]
C31  6.8nF  [CAPC2012X140N]
C32  27pF  [CAPC2012X140N]
C33  27pF  [CAPC2012X140N]
C34  1nF 2kV  [CAPC3216X175N]
C35  100nF  [CAPC2012X140N]
FB1  FB 1k@100MHz  [BEADC2012X105N]
J9  HR911105A  [HANRUN_HR911105A]
R20  10k  [RES_ERA6VRB1002V]
R21  10k  [RES_ERA6VRB1002V]
R22  10k  [RES_ERA6VRB1002V]
R23  12.4k 1%  [RES_ERA6VRB1002V]
R24  49.9R 1%  [RES_ERA6VRB1002V]
R25  49.9R 1%  [RES_ERA6VRB1002V]
R26  49.9R 1%  [RES_ERA6VRB1002V]
R27  49.9R 1%  [RES_ERA6VRB1002V]
R28  10R  [RES_ERA6VRB1002V]
R29  330R  [RES_ERA6VRB1002V]
R30  330R  [RES_ERA6VRB1002V]
R39  47 Ohms  [RES 0805_2012]
R40  47 Ohms  [RES 0805_2012]
R41  47 Ohms  [RES 0805_2012]
R42  47 Ohms  [RES 0805_2012]
U7  W5500  [QFP50P900X900X160-48N]
Y1  25MHz 18pF  [XTAL1170X500X450]

### Nets
3V3: C24.1 C25.1 FB1.1 J9.9(GA) J9.12(YA) R20.2 R21.2 R22.2 U7.28(VDD)
3V3A: C19.1 C20.1 C21.1 C22.1 C23.1 FB1.2 R24.2 R25.2 R28.2 U7.4(AVDD) U7.8(AVDD) U7.11(AVDD) U7.15(AVDD) U7.17(AVDD) U7.21(AVDD)
GND: C19.2 C20.2 C21.2 C22.2 C23.2 C24.2 C25.2 C26.2 C27.2 C28.2 C29.2 C32.2 C33.2 C34.1 C35.2 R23.1 U7.3(AGND) U7.9(AGND) U7.14(AGND) U7.16(AGND) U7.19(AGND) U7.23(RSVD1) U7.29(GND) U7.38(RSVD2) U7.39(RSVD3) U7.40(RSVD4) U7.41(RSVD5) U7.42(RSVD6) U7.48(AGND)
ESP_CS: R42.1
ESP_MISO: R40.1
ESP_MOSI: R41.1
ESP_SCLK: R39.1
ETH_ACT: R30.1 U7.27(ACTLED)
ETH_CS: R20.1 R42.2 U7.32(~{SCSN})
ETH_EXRES: R23.2 U7.10(EXRES1)
ETH_INT: R21.1 U7.36(~{INTN})
ETH_LED_G: J9.10(GC) R29.2
ETH_LED_Y: J9.11(YC) R30.2
ETH_LINK: R29.1 U7.25(LINKLED)
ETH_MISO: R40.2 U7.34(MISO)
ETH_MOSI: R41.2 U7.35(MOSI)
ETH_RCT: C29.1 J9.5(P5) R26.2 R27.2
ETH_RDN: C31.1 J9.6(RD-)
ETH_RDP: C30.1 J9.3(RD+)
ETH_RST: C35.1 R22.1 U7.37(~{RSTN})
ETH_RXN: C31.2 R27.1 U7.5(RXN)
ETH_RXP: C30.2 R26.1 U7.6(RXP)
ETH_SCLK: R39.2 U7.33(SCLK)
ETH_TCT: C28.1 J9.4(P4) R28.1
ETH_TXN: J9.2(TD-) R25.1 U7.1(TXN)
ETH_TXP: J9.1(TD+) R24.1 U7.2(TXP)
ETH_XI: C32.1 U7.30(XI) Y1.2
ETH_XO: C33.1 U7.31(XO) Y1.1
SGND: C34.2 J9.8(GND) J9.15(SHIELD) J9.16(SHIELD)
NetC26_1: C26.1 U7.20(TOCAP)
NetC27_1: C27.1 U7.22(1V2O)

Not connected (* = marked no-connect by the designer): U7 7(DNC)* 18(VBG)* 24(SPDLED)* 26(DUPLED)* 43(PMODE2)* 44(PMODE1)* 45(PMODE0)*

### Notes on the sheet
- (in symbol HR911105A) J8; J7; J6 RX-; J5; J4; J3 RX+; J2 TX-; J1 TX+; 1000pF; 2KV; 75ohm; Green LED; Yellow LED

### Library data of the parts
C19-C22 C24 C35 = CL21B104KCFNNNE: as C10 on sheet esp32p10displaySheet2; Purchase-URL: https://pricing.snapeda.com/search?q=CL21B104KCFNNNE&ref=eda; Package: 0805 Samsung; Check_prices: https://www.snapeda.com/parts/CL21B104KCFNNNE/Samsung+Electro-Mechanics/view-part/?ref=eda; Value: *; SnapEDA_Link: https://www.snapeda.com/parts/CL21B104KCFNNNE/Samsung+Electro-Mechanics/view-part/?ref=snap; MP: CL21B104KCFNNNE; Digi-Key_Part_Number: 1276-6840-2-ND
C23 C25 = CL21B104KCFNNNE: 0.1 ÂµF Â±10% 100V Ceramic Capacitor X7R 0805 (2012 Metric); MF: Samsung; MP: CL21A106KOQNNNE; Purchase-URL: https://pricing.snapeda.com/search?q=CL21B104KCFNNNE&ref=eda; Package: 0805 Samsung; Check_prices: https://www.snapeda.com/parts/CL21B104KCFNNNE/Samsung+Electro-Mechanics/view-part/?ref=eda; Value: *; SnapEDA_Link: https://www.snapeda.com/parts/CL21B104KCFNNNE/Samsung+Electro-Mechanics/view-part/?ref=snap; Digi-Key_Part_Number: 1276-6840-2-ND
C26 = CL21B104KCFNNNE: 0.1 ÂµF Â±10% 100V Ceramic Capacitor X7R 0805 (2012 Metric); MF: Samsung; MP: CL21A475KAQNNNE; Purchase-URL: https://pricing.snapeda.com/search?q=CL21B104KCFNNNE&ref=eda; Package: 0805 Samsung; Check_prices: https://www.snapeda.com/parts/CL21B104KCFNNNE/Samsung+Electro-Mechanics/view-part/?ref=eda; Value: *; SnapEDA_Link: https://www.snapeda.com/parts/CL21B104KCFNNNE/Samsung+Electro-Mechanics/view-part/?ref=snap; Digi-Key_Part_Number: 1276-6840-2-ND
C27 C29 = CL21B104KCFNNNE: 0.1 ÂµF Â±10% 100V Ceramic Capacitor X7R 0805 (2012 Metric); MF: Samsung; MP: CL21B103KBANNNC; Purchase-URL: https://pricing.snapeda.com/search?q=CL21B104KCFNNNE&ref=eda; Package: 0805 Samsung; Check_prices: https://www.snapeda.com/parts/CL21B104KCFNNNE/Samsung+Electro-Mechanics/view-part/?ref=eda; Value: *; SnapEDA_Link: https://www.snapeda.com/parts/CL21B104KCFNNNE/Samsung+Electro-Mechanics/view-part/?ref=snap; Digi-Key_Part_Number: 1276-6840-2-ND
C28 = CL21B104KCFNNNE: 0.1 ÂµF Â±10% 100V Ceramic Capacitor X7R 0805 (2012 Metric); MF: Samsung; MP: CL21B223KBANNNC; Purchase-URL: https://pricing.snapeda.com/search?q=CL21B104KCFNNNE&ref=eda; Package: 0805 Samsung; Check_prices: https://www.snapeda.com/parts/CL21B104KCFNNNE/Samsung+Electro-Mechanics/view-part/?ref=eda; Value: *; SnapEDA_Link: https://www.snapeda.com/parts/CL21B104KCFNNNE/Samsung+Electro-Mechanics/view-part/?ref=snap; Digi-Key_Part_Number: 1276-6840-2-ND
C30 C31 = CL21B104KCFNNNE: 0.1 ÂµF Â±10% 100V Ceramic Capacitor X7R 0805 (2012 Metric); MF: Samsung; MP: CL21B682KBANNNC; Purchase-URL: https://pricing.snapeda.com/search?q=CL21B104KCFNNNE&ref=eda; Package: 0805 Samsung; Check_prices: https://www.snapeda.com/parts/CL21B104KCFNNNE/Samsung+Electro-Mechanics/view-part/?ref=eda; Value: *; SnapEDA_Link: https://www.snapeda.com/parts/CL21B104KCFNNNE/Samsung+Electro-Mechanics/view-part/?ref=snap; Digi-Key_Part_Number: 1276-6840-2-ND
C32 C33 = CL21B104KCFNNNE: 0.1 ÂµF Â±10% 100V Ceramic Capacitor X7R 0805 (2012 Metric); MF: Samsung; MP: CL21C270JBANNNC; Purchase-URL: https://pricing.snapeda.com/search?q=CL21B104KCFNNNE&ref=eda; Package: 0805 Samsung; Check_prices: https://www.snapeda.com/parts/CL21B104KCFNNNE/Samsung+Electro-Mechanics/view-part/?ref=eda; Value: *; SnapEDA_Link: https://www.snapeda.com/parts/CL21B104KCFNNNE/Samsung+Electro-Mechanics/view-part/?ref=snap; Digi-Key_Part_Number: 1276-6840-2-ND
C34 = C1206C102KGRACAUTO: 1000 pF Â±10% 2000V (2kV) Ceramic Capacitor X7R 1206 (3216 Metric); MF: KEMET; SnapEDA_Link: https://www.snapeda.com/parts/C1206C102KGRACAUTO/KEMET/view-part/?ref=snap; Package: 3216 KEMET; Value: *; MP: C1206C102KGRACAUTO; Check_prices: https://www.snapeda.com/parts/C1206C102KGRACAUTO/KEMET/view-part/?ref=eda
FB1 = MPZ2012S102AT000: Package: None; Price: None; Value: *; MP: MPZ2012S102AT000; Availability: Unavailable
J9 = HR911105A: DIP RJ45 Connector;; MF: hanrun; SnapEDA_Link: https://www.snapeda.com/parts/HR911105A/HanRun/view-part/?ref=snap; Package: None; MP: HR911105A; Check_prices: https://www.snapeda.com/parts/HR911105A/HanRun/view-part/?ref=eda; Price: None; Value: *; Availability: Not in stock
R20-R22 = ERA6VRB1002V: Availability: Unavailable; Package: None; MP: ERA6VRB1002V; Value: *; Price: None
R23 = ERA6VRB1002V: MP: ERJ-6ENF1242V; Availability: Unavailable; Package: None; Value: *; Price: None
R24-R27 = ERA6VRB1002V: MP: ERJ-6ENF49R9V; Availability: Unavailable; Package: None; Value: *; Price: None
R28 = ERA6VRB1002V: MP: ERJ-6ENF10R0V; Availability: Unavailable; Package: None; Value: *; Price: None
R29 R30 = ERA6VRB1002V: MP: ERJ-6ENF3300V; Availability: Unavailable; Package: None; Value: *; Price: None
R39-R42 = CPF0805B1K0E: RES SMD 47 OHM 1% 1/8W 0805; Part Number: RC0805FR-0747RL; Manufacturer: YAGEO; Power (Watts): 0.1W, 1/10W; Temperature Coefficient: 100ppm/C; Value: 47 Ohms; Composition: Thick Film; Device Package: 0805 (2012 Metric); Height - Seated (Max): 0.026" (0.65mm); Lifecycle Status: Active; Minimum Order: 1; Number of Terminations: 2; Operating Temperature: -55°C ~ 155°C; Package / Case: 0805 (2012 Metric); Packaging: TapeAndReel; Part Status: Active; Resistance: 47 Ohms; Series: RC; Size / Dimension: 0.079" L x 0.049" W (2.00mm x 1.25mm); Supplier Device Package: 0805; Tolerance: 1%
U7 = W5500: Hardwired TCP/IP embedded Ethernet controller; Availability: Unavailable; MP: W5500; Value: *; Price: None; Package: None
Y1 = FOXSDLF/128-20: 12.288 MHz Â±30ppm Crystal 20pF 60 Ohms HC-49/US; MF: Fox Electronics; MP: ECS-250-18-5PX-TR; SnapEDA_Link: https://www.snapeda.com/parts/FOXSDLF/128-20/Fox+Electronics/view-part/?ref=snap; Package: HC49SD Fox Electronics; Value: *; Check_prices: https://www.snapeda.com/parts/FOXSDLF/128-20/Fox+Electronics/view-part/?ref=eda

## Sheet esp32p10displaySheet4.SchDoc
size A4; SheetNumber: 4; SheetTotal: 4
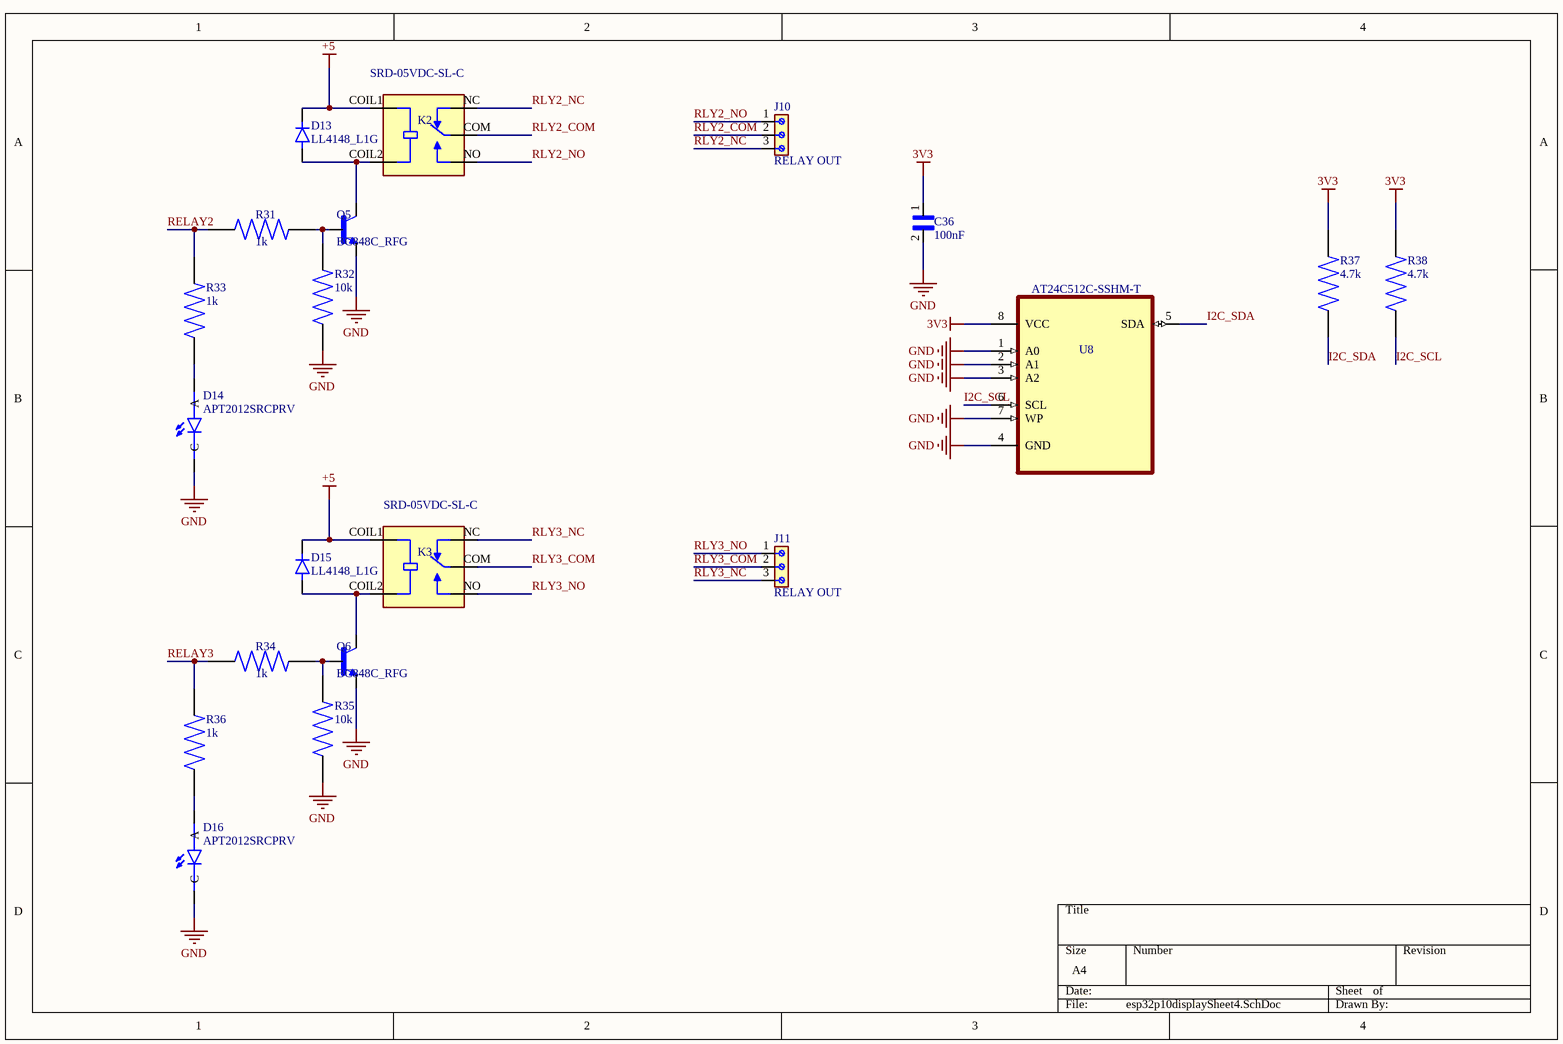
[diagram p3: esp32p10displaySheet4.SchDoc]

### Parts
C36  100nF  [CAPC2012X140N]
D13  LL4148_L1G  [DIOMELF3515N]
D14  APT2012SRCPRV  [LEDC2012X75N]
D15  LL4148_L1G  [DIOMELF3515N]
D16  APT2012SRCPRV  [LEDC2012X75N]
J10  RELAY OUT  [691236510003]
J11  RELAY OUT  [691236510003]
K2  SRD-05VDC-SL-C  [RELAY_SRD-03VDC-SL-C]
K3  SRD-05VDC-SL-C  [RELAY_SRD-03VDC-SL-C]
Q5  BC848C_RFG  [SOT95P237X112-3N]
Q6  BC848C_RFG  [SOT95P237X112-3N]
R31  1k  [RES_ERA6VRB1002V]
R32  10k  [RES_ERA6VRB1002V]
R33  1k  [RES_ERA6VRB1002V]
R34  1k  [RES_ERA6VRB1002V]
R35  10k  [RES_ERA6VRB1002V]
R36  1k  [RES_ERA6VRB1002V]
R37  4.7k  [RES_ERA6VRB1002V]
R38  4.7k  [RES_ERA6VRB1002V]
U8  AT24C512C-SSHM-T  [SOIC127P600X175-8N]

### Nets
3V3: C36.1 R37.2 R38.2 U8.8(VCC)
+5: D13.C(K) D15.C(K) K2.COIL1 K3.COIL1
GND: C36.2 D14.C D16.C Q5.2(E) Q6.2(E) R32.1 R35.1 U8.1(A0) U8.2(A1) U8.3(A2) U8.4(GND) U8.7(WP)
I2C_SCL: R38.1 U8.6(SCL)
I2C_SDA: R37.1 U8.5(SDA)
RELAY2: R31.1 R33.2
RELAY3: R34.1 R36.2
RLY2_COM: J10.2 K2.COM
RLY2_NC: J10.3 K2.NC
RLY2_NO: J10.1 K2.NO
RLY3_COM: J11.2 K3.COM
RLY3_NC: J11.3 K3.NC
RLY3_NO: J11.1 K3.NO
NetD13_A: D13.A K2.COIL2 Q5.3(C)
NetD14_A: D14.A R33.1
NetD15_A: D15.A K3.COIL2 Q6.3(C)
NetD16_A: D16.A R36.1
NetQ5_1: Q5.1(B) R31.2 R32.2
NetQ6_1: Q6.1(B) R34.2 R35.2

### Library data of the parts
C36 = CL21B104KCFNNNE: as C10 on sheet esp32p10displaySheet2; Purchase-URL: https://pricing.snapeda.com/search?q=CL21B104KCFNNNE&ref=eda; Package: 0805 Samsung; Check_prices: https://www.snapeda.com/parts/CL21B104KCFNNNE/Samsung+Electro-Mechanics/view-part/?ref=eda; Value: *; SnapEDA_Link: https://www.snapeda.com/parts/CL21B104KCFNNNE/Samsung+Electro-Mechanics/view-part/?ref=snap; MP: CL21B104KCFNNNE; Digi-Key_Part_Number: 1276-6840-2-ND
D14 D16 = APT2012SRCPRV: as D10 on sheet esp32p10displaySheet1; SnapEDA_Link: https://www.snapeda.com/parts/APT2012SRCPRV/Kingbright/view-part/?ref=snap; Package: 0805 Kingbright; Value: *; MP: APT2012SRCPRV; Check_prices: https://www.snapeda.com/parts/APT2012SRCPRV/Kingbright/view-part/?ref=eda
J10 J11 = 691236510003: as J6 on sheet esp32p10displaySheet1; SnapEDA_Link: https://www.snapeda.com/parts/691236510003/W%25C3%25BCrth+Elektronik+Midcom/view-part/?ref=snap; Package: None; Value: *; MP: 691236510003; Check_prices: https://www.snapeda.com/parts/691236510003/W%25C3%25BCrth+Elektronik+Midcom/view-part/?ref=eda
K2 K3 = SRD-03VDC-SL-C: as K1 on sheet esp32p10displaySheet1; SnapEDA_Link: https://www.snapeda.com/parts/SRD-03VDC-SL-C/Songle+Relay/view-part/?ref=snap; Package: NON STANDARD-5 Songle Relay; Value: *; MP: SRD-05VDC-SL-C; Check_prices: https://www.snapeda.com/parts/SRD-03VDC-SL-C/Songle+Relay/view-part/?ref=eda
Q5 Q6 = BC848C_RFG: as Q1 on sheet esp32p10displaySheet1; SnapEDA_Link: https://www.snapeda.com/parts/BC848C%20RFG/Taiwan+Semiconductor/view-part/?ref=snap; Package: SOT-23 Taiwan Semiconductor; Value: *; Check_prices: https://www.snapeda.com/parts/BC848C%20RFG/Taiwan+Semiconductor/view-part/?ref=eda
R31 R33 R34 R36 = ERA6VRB1002V: MP: ERA6VRB1001V; Availability: Unavailable; Package: None; Value: *; Price: None
R32 R35 = ERA6VRB1002V: Availability: Unavailable; Package: None; MP: ERA6VRB1002V; Value: *; Price: None
R37 R38 = ERA6VRB1002V: MP: ERA6VRB4701V; Availability: Unavailable; Package: None; Value: 4.7k; Price: None
U8 = AT24C512C-SSHM-T: EEPROM Memory IC 512Kb (64K x 8) IÂ²C 400 kHz 900 ns 8-SOIC; MF: Microchip; SnapEDA_Link: https://www.snapeda.com/parts/AT24C512C-SSHM-T/Microchip/view-part/?ref=snap; Package: SO-8 Microchip; Value: *; MP: AT24C512C-SSHM-T; Check_prices: https://www.snapeda.com/parts/AT24C512C-SSHM-T/Microchip/view-part/?ref=eda
D13 D15 = LL4148_L1G: MP: LL4148_L1G; Price: None; Package: None; Availability: Unavailable; Value: *

## Nets that join several sheets
3V3: esp32p10displaySheet1 (12 pins), esp32p10displaySheet2 (R18.2 R19.2), esp32p10displaySheet3 (9 pins), esp32p10displaySheet4 (C36.1 R37.2 R38.2 U8.8)
+5: esp32p10displaySheet1 (9 pins), esp32p10displaySheet4 (D13.C D15.C K2.COIL1 K3.COIL1)
GND: esp32p10displaySheet1 (48 pins), esp32p10displaySheet2 (C17.2 C18.2 U5.3 U6.3), esp32p10displaySheet3 (29 pins), esp32p10displaySheet4 (12 pins)
ISO_5V: esp32p10displaySheet1 (5 pins), esp32p10displaySheet2 (11 pins)
ISO_GND: esp32p10displaySheet1 (5 pins), esp32p10displaySheet2 (15 pins)
ESP_CS: esp32p10displaySheet1 (U1.12), esp32p10displaySheet3 (R42.1)
ESP_MISO: esp32p10displaySheet1 (U1.8), esp32p10displaySheet3 (R40.1)
ESP_MOSI: esp32p10displaySheet1 (U1.9), esp32p10displaySheet3 (R41.1)
ESP_SCLK: esp32p10displaySheet1 (U1.24), esp32p10displaySheet3 (R39.1)
ETH_INT: esp32p10displaySheet1 (U1.4), esp32p10displaySheet3 (R21.1 U7.36)
I2C_SCL: esp32p10displaySheet1 (U1.23), esp32p10displaySheet4 (R38.1 U8.6)
I2C_SDA: esp32p10displaySheet1 (U1.10), esp32p10displaySheet4 (R37.1 U8.5)
IN1: esp32p10displaySheet1 (U1.6), esp32p10displaySheet2 (C17.1 R18.1 U5.4)
IN2: esp32p10displaySheet1 (U1.7), esp32p10displaySheet2 (C18.1 R19.1 U6.4)
ISO_RX: esp32p10displaySheet1 (U4.7), esp32p10displaySheet2 (U2.4)
ISO_TX: esp32p10displaySheet1 (U4.6), esp32p10displaySheet2 (R6.1 U2.5)
RELAY2: esp32p10displaySheet1 (U1.14), esp32p10displaySheet4 (R31.1 R33.2)
RELAY3: esp32p10displaySheet1 (U1.36), esp32p10displaySheet4 (R34.1 R36.2)